# Altium schematic sheet 11 WIFI&BT&GPIO.SchDoc
size A3; Revision: V1.2; SheetNumber: 11; SheetTotal: 11
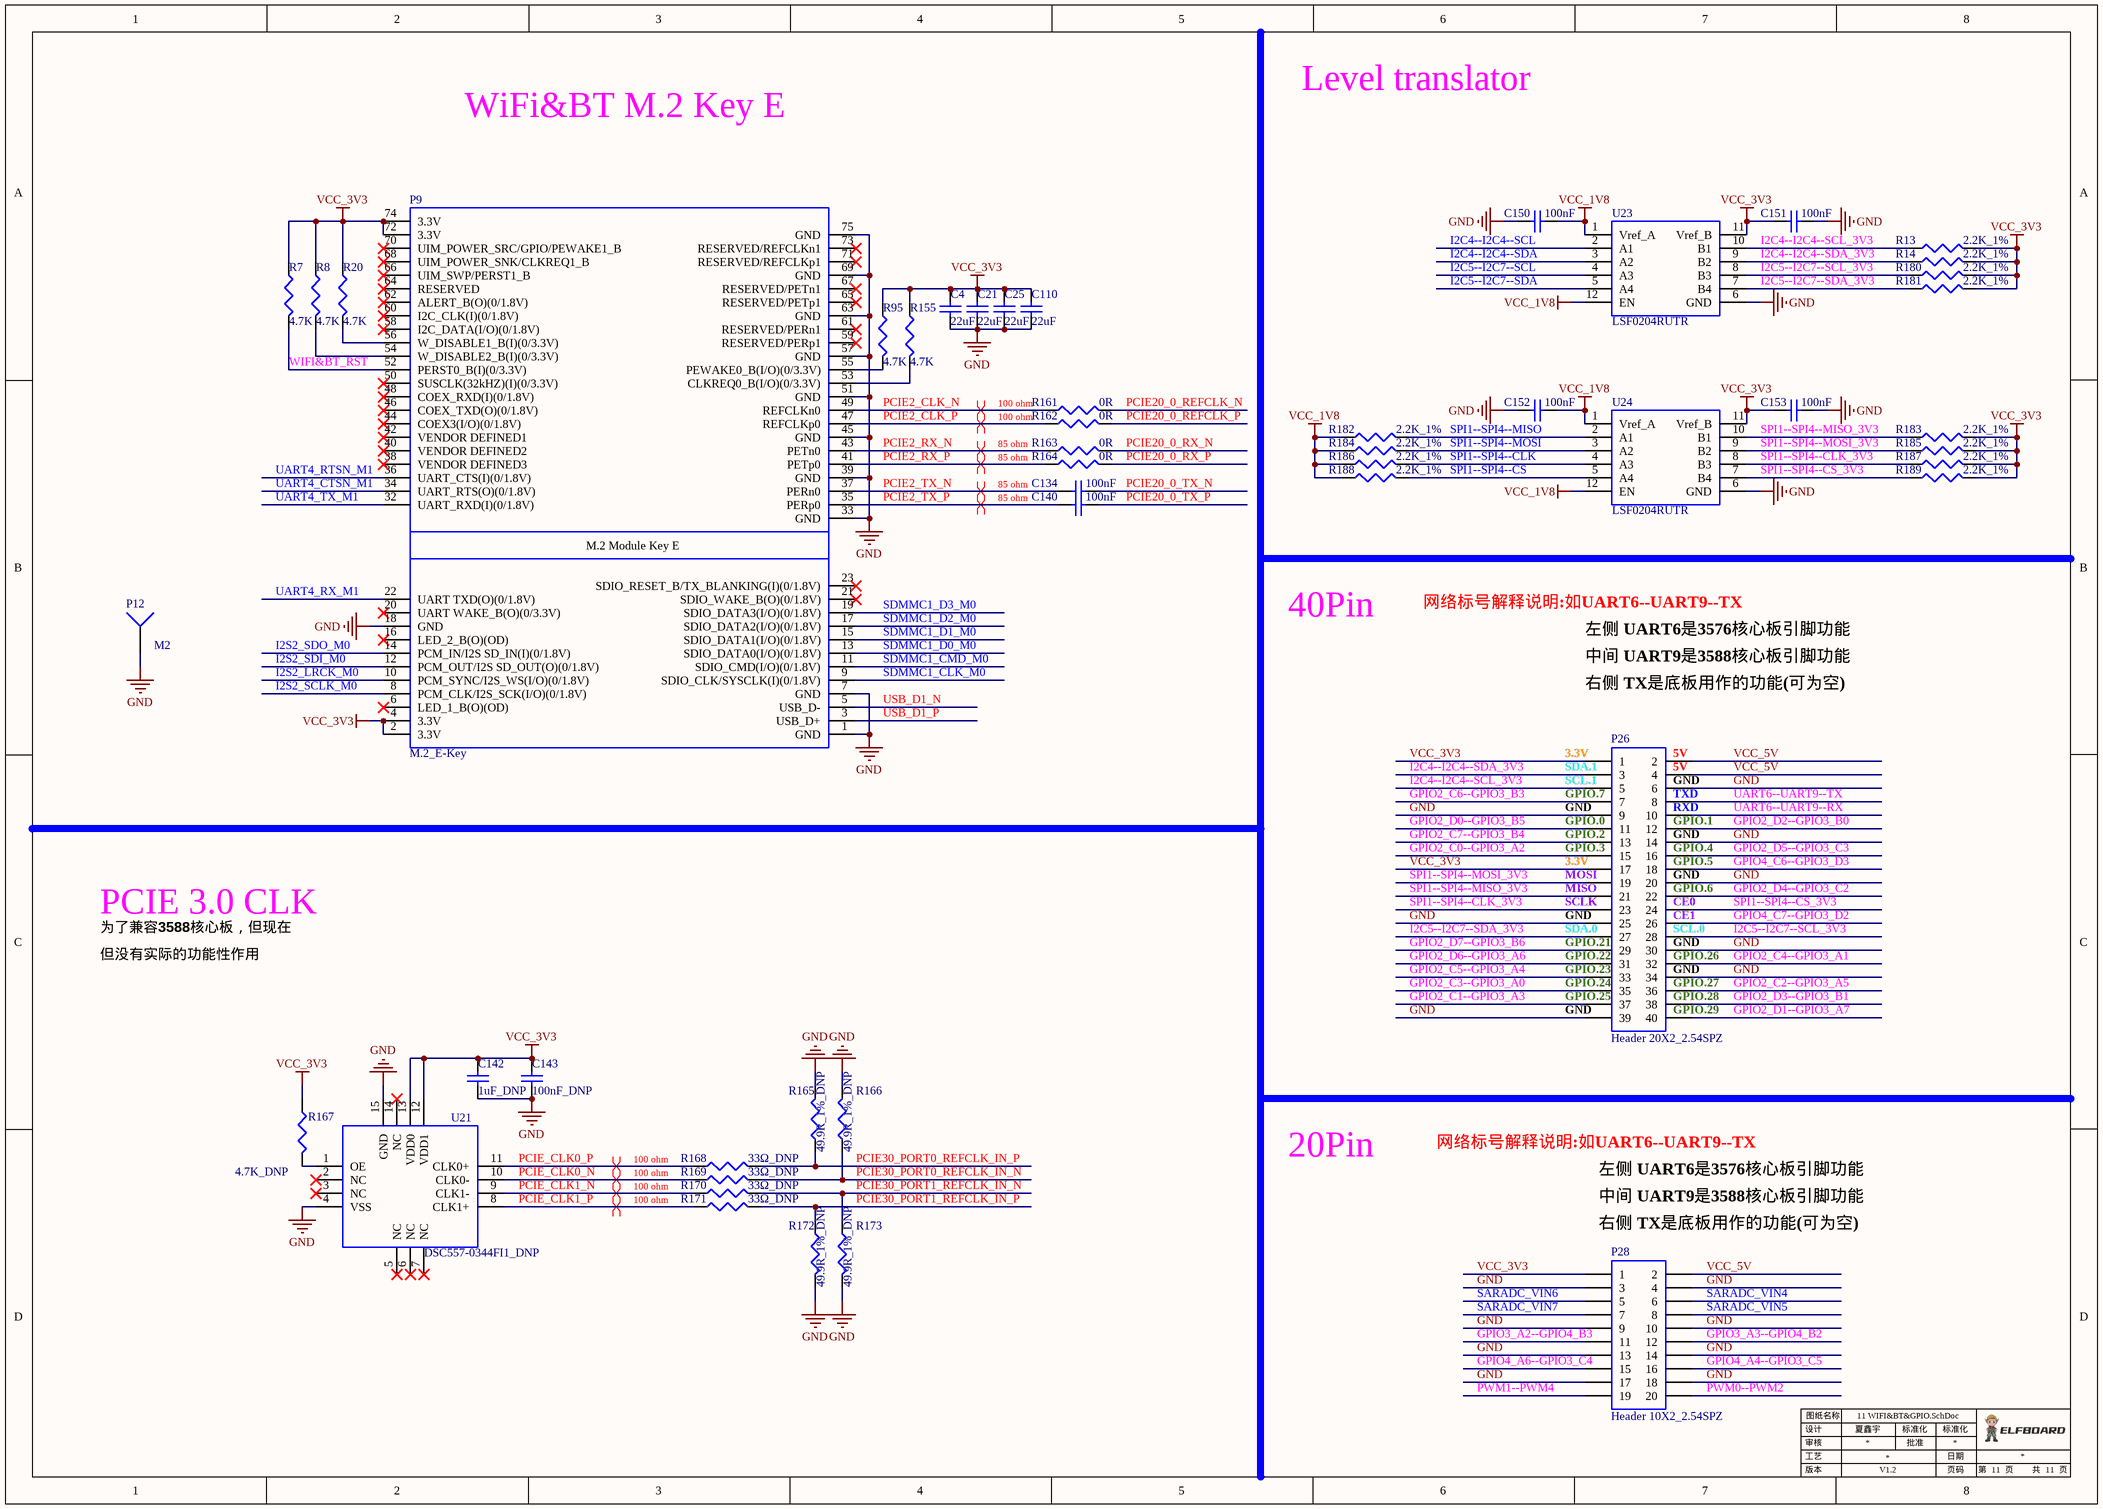
[diagram p0: 11 WIFI&BT&GPIO.SchDoc]

## Parts
C4  22uF  [0603C]
C21  22uF  [0603C]
C25  22uF  [0603C]
C110  22uF  [0603C]
C134  100nF  [0402C]
C140  100nF  [0402C]
C142  1uF_DNP  [0402C]
C143  100nF_DNP  [0402C]
C150  100nF  [0402C]
C151  100nF  [0402C]
C152  100nF  [0402C]
C153  100nF  [0402C]
P9  M.2_E-Key  [M.2_E-Key]
P12  M2  [HOLE3.6-5.6]
P26  Header 20X2_2.54SPZ  [HEADER2*20_2.54_SPZ]
P28  Header 10X2_2.54SPZ  [HEADER2*10_2.54_SPZ]
R7  4.7K  [0402R]
R8  4.7K  [0402R]
R13  2.2K_1%  [0402R]
R14  2.2K_1%  [0402R]
R20  4.7K  [0402R]
R95  4.7K  [0402R]
R155  4.7K  [0402R]
R161  0R  [0402R]
R162  0R  [0402R]
R163  0R  [0402R]
R164  0R  [0402R]
R165  49.9R_1%_DNP  [0201R]
R166  49.9R_1%_DNP  [0201R]
R167  4.7K_DNP  [0402R]
R168  33Ω_DNP  [0201R]
R169  33Ω_DNP  [0201R]
R170  33Ω_DNP  [0201R]
R171  33Ω_DNP  [0201R]
R172  49.9R_1%_DNP  [0201R]
R173  49.9R_1%_DNP  [0201R]
R180  2.2K_1%  [0402R]
R181  2.2K_1%  [0402R]
R182  2.2K_1%  [0402R]
R183  2.2K_1%  [0402R]
R184  2.2K_1%  [0402R]
R185  2.2K_1%  [0402R]
R186  2.2K_1%  [0402R]
R187  2.2K_1%  [0402R]
R188  2.2K_1%  [0402R]
R189  2.2K_1%  [0402R]
U21  DSC557-0344FI1_DNP  [QFN14_2.5*3.2]
U23  LSF0204RUTR  [UQFN]
U24  LSF0204RUTR  [UQFN]

## Nets
GND: C4.1 C21.1 C25.1 C110.1 C142.1 C143.1 C150.1 C151.1 C152.1 C153.1 P9.1(GND) P9.7(GND) P9.18(GND) P9.33(GND) P9.39(GND) P9.45(GND) P9.51(GND) P9.57(GND) P9.63(GND) P9.69(GND) P9.75(GND) P12.1 P26.6 P26.9 P26.14 P26.20 P26.25 P26.30 P26.34 P26.39 P28.3 P28.4 P28.9 P28.10 P28.13 P28.14 P28.17 P28.18 R165.2 R166.2 R172.2 R173.2 U21.4(VSS) U21.15(GND) U23.6(GND) U24.6(GND)
VCC_1V8: C150.2 C152.2 R182.1 R184.1 R186.1 R188.1 U23.1(Vref_A) U23.12(EN) U24.1(Vref_A) U24.12(EN)
VCC_3V3: C4.2 C21.2 C25.2 C110.2 C142.2 C143.2 C151.2 C153.2 P9.2(3.3V) P9.4(3.3V) P9.72(3.3V) P9.74(3.3V) P26.1 P26.17 P28.1 R7.1 R8.1 R13.2 R14.2 R20.1 R95.1 R155.1 R167.1 R180.2 R181.2 R183.2 R185.2 R187.2 R189.2 U21.12(VDD1) U21.13(VDD0) U23.11(Vref_B) U24.11(Vref_B)
GPIO2_C0--GPIO3_A2: P26.15
GPIO2_C1--GPIO3_A3: P26.37
GPIO2_C2--GPIO3_A5: P26.36
GPIO2_C3--GPIO3_A0: P26.35
GPIO2_C4--GPIO3_A1: P26.32
GPIO2_C5--GPIO3_A4: P26.33
GPIO2_C6--GPIO3_B3: P26.7
GPIO2_C7--GPIO3_B4: P26.13
GPIO2_D0--GPIO3_B5: P26.11
GPIO2_D1--GPIO3_A7: P26.40
GPIO2_D2--GPIO3_B0: P26.12
GPIO2_D3--GPIO3_B1: P26.38
GPIO2_D4--GPIO3_C2: P26.22
GPIO2_D5--GPIO3_C3: P26.16
GPIO2_D6--GPIO3_A6: P26.31
GPIO2_D7--GPIO3_B6: P26.29
GPIO3_A2--GPIO4_B3: P28.11
GPIO3_A3--GPIO4_B2: P28.12
GPIO4_A4--GPIO3_C5: P28.16
GPIO4_A6--GPIO3_C4: P28.15
GPIO4_C6--GPIO3_D3: P26.18
GPIO4_C7--GPIO3_D2: P26.26
I2C4--I2C4--SCL: U23.2(A1)
I2C4--I2C4--SCL_3V3: P26.5 R13.1 U23.10(B1)
I2C4--I2C4--SDA: U23.3(A2)
I2C4--I2C4--SDA_3V3: P26.3 R14.1 U23.9(B2)
I2C5--I2C7--SCL: U23.4(A3)
I2C5--I2C7--SCL_3V3: P26.28 R180.1 U23.8(B3)
I2C5--I2C7--SDA: U23.5(A4)
I2C5--I2C7--SDA_3V3: P26.27 R181.1 U23.7(B4)
I2S2_LRCK_M0: P9.10(PCM_SYNC/I2S_WS(I/O)(0/1.8V))
I2S2_SCLK_M0: P9.8(PCM_CLK/I2S_SCK(I/O)(0/1.8V))
I2S2_SDI_M0: P9.12(PCM_OUT/I2S_SD_OUT(O)(0/1.8V))
I2S2_SDO_M0: P9.14(PCM_IN/I2S_SD_IN(I)(0/1.8V))
PCIE2_CLK_N: P9.49(REFCLKn0) R161.1
PCIE2_CLK_P: P9.47(REFCLKp0) R162.1
PCIE2_RX_N: P9.43(PETn0) R163.1
PCIE2_RX_P: P9.41(PETp0) R164.1
PCIE2_TX_N: C134.1 P9.37(PERn0)
PCIE2_TX_P: C140.1 P9.35(PERp0)
PCIE20_0_REFCLK_N: R161.2
PCIE20_0_REFCLK_P: R162.2
PCIE20_0_RX_N: R163.2
PCIE20_0_RX_P: R164.2
PCIE20_0_TX_N: C134.2
PCIE20_0_TX_P: C140.2
PCIE30_PORT0_REFCLK_IN_N: R166.1 R169.2
PCIE30_PORT0_REFCLK_IN_P: R165.1 R168.2
PCIE30_PORT1_REFCLK_IN_N: R170.2 R173.1
PCIE30_PORT1_REFCLK_IN_P: R171.2 R172.1
PCIE_CLK0_N: R169.1 U21.10(CLK0-)
PCIE_CLK0_P: R168.1 U21.11(CLK0+)
PCIE_CLK1_N: R170.1 U21.9(CLK1-)
PCIE_CLK1_P: R171.1 U21.8(CLK1+)
PWM0--PWM2: P28.20
PWM1--PWM4: P28.19
SARADC_VIN4: P28.6
SARADC_VIN5: P28.8
SARADC_VIN6: P28.5
SARADC_VIN7: P28.7
SDMMC1_CLK_M0: P9.9(SDIO_CLK/SYSCLK(I)(0/1.8V))
SDMMC1_CMD_M0: P9.11(SDIO_CMD(I/O)(0/1.8V))
SDMMC1_D0_M0: P9.13(SDIO_DATA0(I/O)(0/1.8V))
SDMMC1_D1_M0: P9.15(SDIO_DATA1(I/O)(0/1.8V))
SDMMC1_D2_M0: P9.17(SDIO_DATA2(I/O)(0/1.8V))
SDMMC1_D3_M0: P9.19(SDIO_DATA3(I/O)(0/1.8V))
SPI1--SPI4--CLK: R186.2 U24.4(A3)
SPI1--SPI4--CLK_3V3: P26.23 R187.1 U24.8(B3)
SPI1--SPI4--CS: R188.2 U24.5(A4)
SPI1--SPI4--CS_3V3: P26.24 R189.1 U24.7(B4)
SPI1--SPI4--MISO: R182.2 U24.2(A1)
SPI1--SPI4--MISO_3V3: P26.21 R183.1 U24.10(B1)
SPI1--SPI4--MOSI: R184.2 U24.3(A2)
SPI1--SPI4--MOSI_3V3: P26.19 R185.1 U24.9(B2)
UART4_CTSN_M1: P9.34(UART_RTS(O)(0/1.8V))
UART4_RTSN_M1: P9.36(UART_CTS(I)(0/1.8V))
UART4_RX_M1: P9.22(UART_TXD(O)(0/1.8V))
UART4_TX_M1: P9.32(UART_RXD(I)(0/1.8V))
UART6--UART9--RX: P26.10
UART6--UART9--TX: P26.8
USB_D1_N: P9.5(USB_D-)
USB_D1_P: P9.3(USB_D+)
VCC_5V: P26.2 P26.4 P28.2
WIFI&BT_RST: P9.52(PERST0_B(I)(0/3.3V)) R7.2
NetP9_53: P9.53(CLKREQ0_B(I/O)(0/3.3V)) R155.2
NetP9_54: P9.54(W_DISABLE2_B(I)(0/3.3V)) R8.2
NetP9_55: P9.55(PEWAKE0_B(I/O)(0/3.3V)) R95.2
NetP9_56: P9.56(W_DISABLE1_B(I)(0/3.3V)) R20.2
NetR167_2: R167.2 U21.1(OE)

Not connected (* = marked no-connect by the designer): P9 6(LED_1_B(O)(OD))* 16(LED_2_B(O)(OD))* 20(UART_WAKE_B(O)(0/3.3V))* 21(SDIO_WAKE_B(O)(0/1.8V))* 23(SDIO_RESET_B/TX_BLANKING(I)(0/1.8V))* 38(VENDOR_DEFINED3)* 40(VENDOR_DEFINED2)* 42(VENDOR_DEFINED1)* 44(COEX3(I/O)(0/1.8V))* 46(COEX_TXD(O)(0/1.8V))* 48(COEX_RXD(I)(0/1.8V))* 50(SUSCLK(32kHZ)(I)(0/3.3V))* 58(I2C_DATA(I/O)(0/1.8V))* 59(RESERVED/PERp1)* 60(I2C_CLK(I)(0/1.8V))* 61(RESERVED/PERn1)* 62(ALERT_B(O)(0/1.8V))* 64(RESERVED)* 65(RESERVED/PETp1)* 66(UIM_SWP/PERST1_B)* 67(RESERVED/PETn1)* 68(UIM_POWER_SNK/CLKREQ1_B)* 70(UIM_POWER_SRC/GPIO/PEWAKE1_B)* 71(RESERVED/REFCLKp1)* 73(RESERVED/REFCLKn1)*; U21 2(NC)* 3(NC)* 5(NC)* 6(NC)* 7(NC)* 14(NC)*

## Layout directives
differential pair; differential pair class 100 ohm: PCIE2_CLK_N, PCIE2_CLK_P, PCIE_CLK0_N, PCIE_CLK0_P, PCIE_CLK1_N, PCIE_CLK1_P
differential pair; differential pair class 85 ohm: PCIE2_RX_N, PCIE2_RX_P, PCIE2_TX_N, PCIE2_TX_P

## Notes on the sheet
- Level translator
- WiFi&BT M.2 Key E
- 40Pin
- 网络标号解释说明:如UART6--UART9--TX
- 左侧 UART6是3576核心板引脚功能
- 中间 UART9是3588核心板引脚功能
- 右侧 TX是底板用作的功能(可为空)
- (near P26) 3.3V
- (near P26) SDA.1
- (near P26) SCL.1
- (near P26) 5V
- (near P26) GND
- (near P26) GPIO.7
- (near P26) GPIO.0
- (near P26) GPIO.2
- (near P26) GPIO.3
- (near P26) TXD
- (near P26) RXD
- (near P26) GPIO.1
- (near P26) GPIO.4
- PCIE 3.0 CLK
- (near P26) MOSI
- (near P26) MISO
- (near P26) SCLK
- (near P26) GPIO.5
- (near P26) GPIO.6
- (near P26) CE0
- (near P26) CE1
- 为了兼容3588核心板，但现在
- 但没有实际的功能性作用
- (near P26) SDA.0
- (near P26) GPIO.21
- (near P26) GPIO.22
- (near P26) GPIO.23
- (near P26) GPIO.24
- (near P26) SCL.0
- (near P26) GPIO.26
- (near P26) GPIO.27
- (near P26) GPIO.25
- (near P26) GPIO.28
- (near P26) GPIO.29
- 20Pin
- (near P28) 右侧 TX是底板用作的功能(可为空)
- 设计
- 审核
- 工艺
- 图纸名称
- 夏鑫宇
- 批准
- 标准化
- 日期
- 版本
- 页码
- 第
- 页
- 共
- (in symbol 1120201188) M.2 Module Key E

## Library data of the parts
C4 C21 C25 C110 = 1110203040: 序号: 675; 存货名称: 贴装叠层陶瓷电容; 规格型号: 0603,22uF,6.3V,±20％,X5R; 主计量单位名称: 个; 安全库存: 678357; 旧编码: 010202048; 旧规格型号: 0603 22uF 6.3V ±20％ X5R; Published: 8-Jun-2000; LatestRevisionDate: 17-Jul-2002; LatestRevisionNote: Re-released for DXP Platform.; PackageReference: RAD-0.3; Publisher: Altium Limited; PackageDescription: Radial Cap, Thru-Hole; 2 Leads; 0.3 in Pin Spacing; Value: 22uF; 存货编码: 1110203040
C134 C140 C143 = 1110202039: 序号: 626; 存货名称: 贴装叠层陶瓷电容; 规格型号: 0402,100nF,25V,±10％,X5R; Published: 8-Jun-2000; LatestRevisionDate: 17-Jul-2002; LatestRevisionNote: Re-released for DXP Platform.; PackageReference: RAD-0.3; Publisher: Altium Limited; PackageDescription: Radial Cap, Thru-Hole; 2 Leads; 0.3 in Pin Spacing; 存货编码: 1110202039
  C134 C140: Value: 100nF
  C143: Value: 100nF_DNP
C142 = 1110202021: 序号: 600; 存货名称: 贴装叠层陶瓷电容; 规格型号: 0402,1uF,16V,±10％,X5R; Published: 8-Jun-2000; LatestRevisionDate: 17-Jul-2002; LatestRevisionNote: Re-released for DXP Platform.; PackageReference: RAD-0.3; Publisher: Altium Limited; PackageDescription: Radial Cap, Thru-Hole; 2 Leads; 0.3 in Pin Spacing; Value: 1uF_DNP; 存货编码: 1110202021
C150-C153 = 1110202001: 序号: 570; 存货名称: 贴装叠层陶瓷电容; 规格型号: 0402,100nF,16V,±10％,X7R; 主计量单位名称: 个; 安全库存: 2580445; 旧编码: 010201001; 旧规格型号: 0402 100nF 16V ±10％ X7R; Published: 8-Jun-2000; LatestRevisionDate: 17-Jul-2002; LatestRevisionNote: Re-released for DXP Platform.; PackageReference: RAD-0.3; Publisher: Altium Limited; PackageDescription: Radial Cap, Thru-Hole; 2 Leads; 0.3 in Pin Spacing; Value: 100nF; 存货编码: 1110202001
P9 = 1120201188: 存货名称: 插槽; 规格型号: M.2,0.5PITCH, H3,KEY E; 存货编码: 1120201188; Value: M.2_E-Key
P12 = 1150303066: 存货名称: 贴片螺母; 规格型号: M2mm,长1.5mm; LatestRevisionDate: 17-Jul-2002; LatestRevisionNote: Re-released for DXP Platform.; Publisher: Altium Limited; Value: M2; 存货编码: 1150303066
P26 = 1120201351: 存货名称: 插装插针; 规格型号: 双排,2*20P,2.54mm,S,镀金,塑胶是彩色,兼容树莓派; 禁用: 否; LatestRevisionDate: 17-Jul-2002; LatestRevisionNote: Re-released for DXP Platform.; Publisher: Altium Limited; Value: Header 20X2_2.54SPZ; 存货编码: 1120201351
P28 = 1120201363: 存货名称: 插装插针; 规格型号: 双排,2*10P,2.54mm,S,镀金; 禁用: 否; LatestRevisionDate: 17-Jul-2002; LatestRevisionNote: Re-released for DXP Platform.; Publisher: Altium Limited; Value: Header 10X2_2.54SPZ; 存货编码: 1120201363
R7 R8 R20 R95 R155 R167 = 1110102003: 序号: 23; 存货名称: 贴装电阻; 规格型号: 0402,4.7K,±5％; 禁用: #REF!; 近三年购买频次（更新至2023/12/7）: 近三年购买频次,59; 存货编码: 1110102003; 最近一次购买记录(更新至20231207）: 2023/11/21; 料号建立日期: 2019/7/2
  R7 R8 R20 R95 R155: Value: 4.7K
  R167: Value: 4.7K_DNP
R13 R14 R180-R189 = 1110102038: 序号: 58; 存货名称: 贴装电阻; 规格型号: 0402,2.2K,±1％; 禁用: 否; 近三年购买频次（更新至2023/12/7）: 近三年购买频次,47; Value: 2.2K_1%; 存货编码: 1110102038; 最近一次购买记录(更新至20231207）: 2023/11/28; 料号建立日期: 2019/7/2
R161-R164 = 1110102001: 序号: 10; 存货名称: 贴装电阻; 规格型号: 0402,0Ω,±5％; Value: 0R; 存货编码: 1110102001
R165 R166 R172 R173 = 1110101027: 存货名称: 贴装电阻; 规格型号: 0201,49.9Ω,±1％; Value: 49.9R_1%_DNP; 存货编码: 1110101027
R168-R171 = 1110101032: 序号: 4737; 存货名称: 贴装电阻; 规格型号: 0201,33Ω,±5%; 禁用: 否; 近三年购买频次（更新至2023/12/7）: 近三年购买频次,3; Value: 33Ω_DNP; 存货编码: 1110101032; 最近一次购买记录(更新至20231207）: 2023/9/6; 料号建立日期: 2022/9/2
U21 = 1110405372: 存货名称: 常规IC; 规格型号: DSC557-0344FL1,14-Lead 2.5 mm x 3.2 mm QFN,–40°C to +105°C; 序号: 4269; 描述: Microchip/美国微芯; 禁用: 否; 近三年购买频次（更新至2023/12/7）: 近三年购买频次,11; Value: DSC557-0344FI1_DNP; 存货编码: 1110405372; 最近一次购买记录(更新至20231207）: 2023/10/17; 料号建立日期: 2022/1/11
U23 U24 = 1110405038: 序号: 1916; 存货名称: 常规IC; 主计量单位名称: 片; 安全库存: 2609; 旧编码: 010503063; Value: LSF0204RUTR; 存货编码: 1110405038; 规格型号: LSF0204RUTR; 旧规格型号: LSF0204RUTR